# Altium schematic sheet 500_BUCK_ADJ.SchDoc: CONVERTIDOR AJUSTABLE
size A4; Date: 23/10/2026; DrawnBy: Santiago Londoño; SheetNumber: 5; SheetTotal: 8
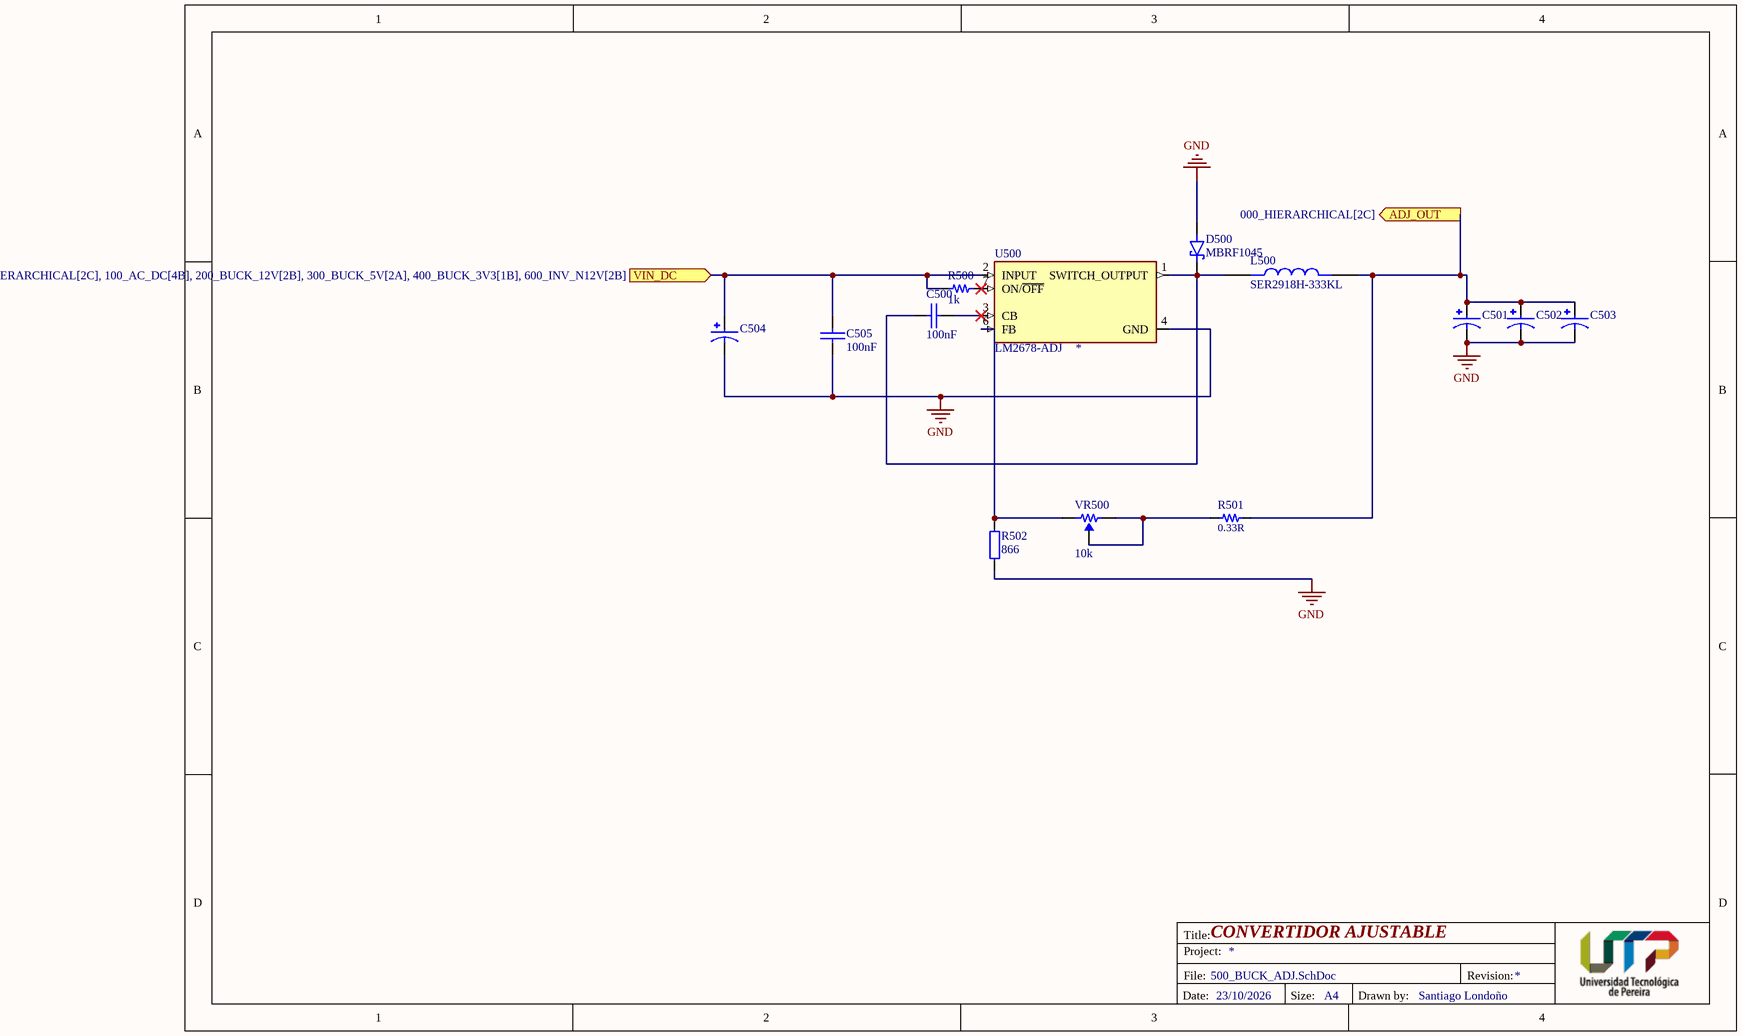
[diagram p0: 500_BUCK_ADJ.SchDoc]

## Parts
C500  value 100nF  [1206]  (hidden comment: 100nF 100V)
C501  EEUFR1H561B  [CAPPRD500W60D1250H2500]  (value not drawn)
C502  EEUFR1H561B  [CAPPRD500W60D1250H2500]  (value not drawn)
C503  EEUFR1H561B  [CAPPRD500W60D1250H2500]  (value not drawn)
C504  EEUFR1H561B  [CAPPRD500W60D1250H2500]  (value not drawn)
C505  value 100nF  [1206]  (hidden comment: 100nF 100V)
D500  MBRF1045  [TO508P995X450X1960-2]
L500  SER2918H-333KL  [IND_SER2918H-333KL]
R500  value 1k  [0201]  (hidden comment: 1k 1/20W)
R501  value 0.33R  [1206]  (hidden comment: 0R33 3/4W)
R502  866  [RES_0805]
U500  LM2678-ADJ  [TO127P1041X469X2199-7N]
VR500  value 10k  [Pot_3x1_5mm_TH]  (hidden comment: 10k 1/5W)

## Ports
ADJ_OUT (out, see 000_HIERARCHICAL[2C]), VIN_DC (in, see 000_HIERARCHICAL[2C], 100_AC_DC[4B], 200_BUCK_12V[2B], 300_BUCK_5V[2A], 400_BUCK_3V3[1B], 600_INV_N12V[2B])

## Nets
GND: C501.N C502.N C503.N C504.N C505.2 D500.2(A) R502.1 U500.4(GND)
ADJ_OUT: C501.P C502.P C503.P L500.2 R501.2 ; port ADJ_OUT
VIN_DC: C504.P C505.1 R500.2 U500.2(INPUT) ; port VIN_DC
NetC500_1: C500.1 D500.1(K) L500.1 U500.1(SWITCH_OUTPUT)
NetC500_2: C500.2 U500.3(CB)
NetR500_1: R500.1 U500.7(ON/~{OFF})
NetR501_1: R501.1 VR500.1 VR500.2
NetR502_2: R502.2 U500.6(FB) VR500.3

## Notes on the sheet
- Title:
- Project:
- File:
- Revision:
- Date:
- Size:
- A4
- Drawn by:

## Library data of the parts
C500 C505 = Cap_0.1uF_1206_100V: CAP CER 0.1UF 100V X7R 1206; Manufacturer: Samsung Electro-Mechanics; Manufacturer Part Number: CL31B104KCFNNNE; Supplier 1: Digi-Key; Supplier Part Number 1: 1276-1151-1-ND; Last modified by: J.Jaramillo; Last modified date: 20240309; ComponentLink1Description: Digi-Key; ComponentLink1URL: https://www.digikey.com/en/products/detail/samsung-electro-mechanics/CL31B104KCFNNNE/3886809
C501-C504 = EEUFR1H561B: MF: {'manufacturer': u'Panasonic Electronic Components'}; Package: None; Price: None; Value: *; MP: EEUFR1H561B; Availability: Unavailable
L500 = SER2918H-333KL: INDUCTOR, PWR, 33UH, 28A, 0.1, 10MHZ; Product Range:COILCRAFT - SER2900 Series; Inductance:33ÂµH; Inductance Tolerance:Â± 10%; Inductor Construction:Shielded; DC Resistance Max:2860Âµohm; RMS Current (Irms):28A; Saturation Current (Isat):7A; Case Dimensio; SnapEDA_Link: https://www.snapeda.com/parts/SER2918H-333KL/Coilcraft/view-part/?ref=snap; Package: None; Value: *; MF: Coilcraft; MP: SER2918H-333KL; Check_prices: https://www.snapeda.com/parts/SER2918H-333KL/Coilcraft/view-part/?ref=eda
R500 = Res_1k_0201_1/20W: RES 1K OHM 1% 1/20W 0201; Manufacturer: YAGEO; Manufacturer Part Number: RC0201FR-071KL; Supplier 1: Digi-Key; Supplier Part Number 1: 311-1KMCT-ND; Reel Stock: N/A; Last modified by: J.Jaramillo; Last modified date: 20240310; ComponentLink1Description: Digi-Key; ComponentLink1URL: https://www.digikey.com/en/products/detail/yageo/RC0201FR-071KL/3202389?s=N4IgTCBcDaIMwEYEFoEGkCyBhAKsgcgCIgC6AvkA
R501 = Res_0R33_1206_3/4W: RES 0.33 OHM 1% 3/4W 1206; Manufacturer: Susumu; Manufacturer Part Number: KRL1632E-M-R330-F-T5; Reel Stock: N/A; Last modified by: J.Jaramillo; Last modified date: 20240310; ComponentLink1Description: Digi-key; ComponentLink1URL: https://www.digikey.com/products/en?keywords=408-1588-1-ND; Supplier 1: Digi-Key; Supplier Part Number 1: 408-1588-1-ND
R502 = RES_0805: Resistor SMD 0805; Manufacturer: *; Manufacturer Part Number: *; Distributor Link: *; LCSC: *
U500 = LM2678T-ADJ: 8V to 40V, 5A SIMPLE SWITCHER buck converter with high efficiency 7-TO-220 -40 to 125; MF: Texas Instruments; SnapEDA_Link: https://www.snapeda.com/parts/LM2678T-ADJ/Texas+Instruments/view-part/?ref=snap; Package: TO-220-7 Texas Instruments; Value: *; MP: LM2678T-ADJ; Check_prices: https://www.snapeda.com/parts/LM2678T-ADJ/Texas+Instruments/view-part/?ref=eda
VR500 = Pot_10k_1/5W_TH: POT 10K OHM 1/5W PLASTIC LINEAR; Manufacturer: TT Electronics/BI; Manufacturer Part Number: P160KN-0QC15B10K; Reel Stock: N/A; Last modified by: J.Jaramillo; Last modified date: 20240310; ComponentLink1Description: Digi-key; ComponentLink1URL: https://www.digikey.com/products/en?keywords=P160KN-0QC15B10K; Supplier 1: Digi-Key; Supplier Part Number 1: 987-1301-ND
D500 = MBRF1045: Availability: Unavailable; Value: *; Package: None; MP: MBRF1045; Price: None